# Altium schematic sheet Display.SchDoc: Display
size Tabloid; Author: Adam Turaj; SheetNumber: 6; SheetTotal: 6
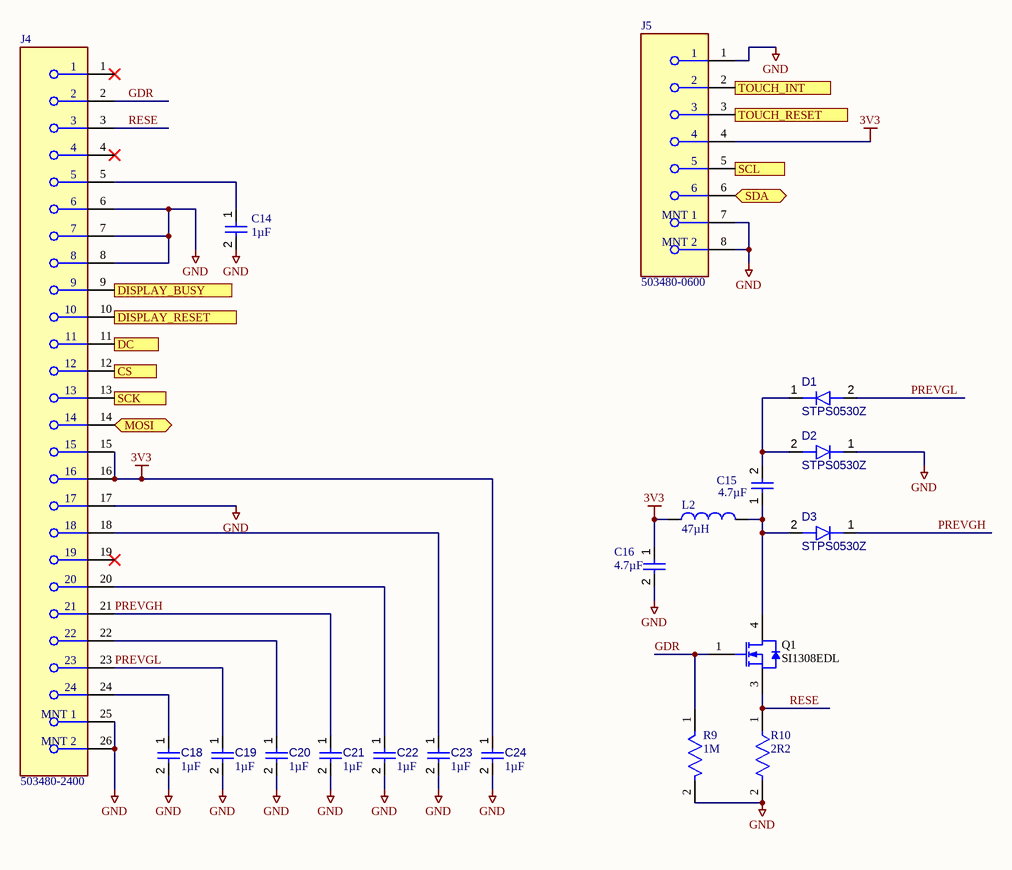
[diagram p0: Display.SchDoc]

## Parts
C14  1µF  [CAPC1608X90X40LL10T20]
C15  4.7µF  [CAPC0603(1608)100_L]
C16  4.7µF  [CAPC0603(1608)100_L]
C18  value 1µF  [CAPC0603(1608)100_L]  (hidden comment: Capacitor 1µF +/-0.1% 25V 0603)
C19  value 1µF  [CAPC0603(1608)100_L]  (hidden comment: Capacitor 1µF +/-0.1% 25V 0603)
C20  value 1µF  [CAPC0603(1608)100_L]  (hidden comment: Capacitor 1µF +/-0.1% 25V 0603)
C21  value 1µF  [CAPC0603(1608)100_L]  (hidden comment: Capacitor 1µF +/-0.1% 25V 0603)
C22  value 1µF  [CAPC0603(1608)100_L]  (hidden comment: Capacitor 1µF +/-0.1% 25V 0603)
C23  value 1µF  [CAPC0603(1608)100_L]  (hidden comment: Capacitor 1µF +/-0.1% 25V 0603)
C24  value 1µF  [CAPC0603(1608)100_L]  (hidden comment: Capacitor 1µF +/-0.1% 25V 0603)
D1  STPS0530Z  [MCC-SOD123_V]
D2  STPS0530Z  [MCC-SOD123_V]
D3  STPS0530Z  [MCC-SOD123_V]
J4  503480-2400  [FP-503480-2400-MFG]
J5  503480-0600  [MOLX-503480-0600]
L2  value 47µH  [FP-SDE0403AT-MFG]  (hidden comment: SDE0403AT-470K)
Q1  SI1308EDL  [FP-5549-IPC_A]
R9  1M  [FP-RC0603-0_55-IPC_C]
R10  2R2  [FP-RC0603-0_55-IPC_A]

## Ports
CS (in, see Root[4B]), DC (in, see Root[4B]), DISPLAY_BUSY (out, see Root[4B], MCU[5B]), DISPLAY_RESET (in, see Root[4B], MCU[5B]), MOSI (bidir, see Root[4B]), SCK (in, see Root[4B]), SCL (in, see Root[4B], Battery_Charger[2C], IMU[4B], MCU[5B]), SDA (bidir, see Root[4B], Battery_Charger[2C], IMU[4B], MCU[5B]), TOUCH_INT (out, see Root[4C], MCU[3C]), TOUCH_RESET (in, see Root[4B], MCU[3C])

## Nets
3V3: C16.1 C24.1 J4.15 J4.16 J5.4 L2.1
GND: C14.2 C16.2 C18.2 C19.2 C20.2 C21.2 C22.2 C23.2 C24.2 D2.1(K) J4.6 J4.7 J4.8 J4.17 J4.25(MNT_1) J4.26(MNT_2) J5.1 J5.7(MNT_1) J5.8(MNT_2) R9.2 R10.2
CS: J4.12 ; port CS
DC: J4.11 ; port DC
DISPLAY_BUSY: J4.9 ; port DISPLAY_BUSY
DISPLAY_RESET: J4.10 ; port DISPLAY_RESET
GDR: J4.2 Q1.1(G) R9.1
MOSI: J4.14 ; port MOSI
PREVGH: C21.1 D3.1(K) J4.21
PREVGL: C19.1 D1.2(A) J4.23
RESE: J4.3 Q1.3(S) R10.1
SCK: J4.13 ; port SCK
SCL: J5.5 ; port SCL
SDA: J5.6 ; port SDA
TOUCH_INT: J5.2 ; port TOUCH_INT
TOUCH_RESET: J5.3 ; port TOUCH_RESET
NetC14_1: C14.1 J4.5
NetC15_1: C15.1 D3.2(A) L2.2 Q1.4(D)
NetC15_2: C15.2 D1.1(K) D2.2(A)
NetC18_1: C18.1 J4.24
NetC20_1: C20.1 J4.22
NetC22_1: C22.1 J4.20
NetC23_1: C23.1 J4.18

Not connected (* = marked no-connect by the designer): J4 1* 4* 19*

## Notes on the sheet
- Title:
- Author:
- Size:
- Date:
- Git Hash:
- Tabloid
- Prj:
- Variant:
- Edited:
- File:

## Library data of the parts
C14 = CMP-001-00005-6: Chip Capacitor, 1 uF, +/- 10%, 25 V, 0603 (1608 Metric); Capacitor Type: Ceramic; Voltage Rating: 25V; Pins: 2; Value: 1µF; Mounting Technology: SM; RoHS Compliant: True; Max Operating Temperature: 125°C; Case/Package: 0603; Min Operating Temperature: -55°C; Tolerance: 10%
C15 = CMP-001-00076-4: Chip Capacitor, 4.7µF +/-20%, 25V, 0603, Thickness 1 mm; Tolerance: 10%; Mounting Technology: SMT; Case/Package: 0603; Pins: 2; Min Operating Temperature: -55°C; Max Operating Temperature: 85°C; Value: 4.7µF; Voltage Rating: 25V
C16 = CMP-001-00076-4: Chip Capacitor, 4.7µF +/-20%, 10V, 0603, Thickness 1 mm; Tolerance: 10%; Mounting Technology: SMT; Case/Package: 0603; Pins: 2; Min Operating Temperature: -55°C; Max Operating Temperature: 85°C; Value: 4.7µF; Voltage Rating: 10V
C18-C24 = CMP-001-00055-4: Chip Capacitor, 1µF +/-0.1%, 25V, 0603, Thickness 1 mm; Tolerance: 20%; Min Operating Temperature: -55°C; Max Operating Temperature: 85°C; Voltage Rating: 25V; Mounting Technology: SMT; Case/Package: 0603; Pins: 2
D1-D3 = CMP-004-00031-1: SCHOTTKY RECTIFIER Rectifier Diode, Schottky, 1 Phase, 1 Element, 0.5A, 30V V(RRM), Silicon; Forward Current: 500mA; Max Surge Current: 5.5A; Forward Voltage: 220mV; Min Operating Temperature: -40°C; Mounting Technology: Surface Mount; Pins: 2; Max Operating Temperature: 150°C
J4 = CMP-002-00076-1: Molex 503480-2400 FFC & FPC Connectors, 0.5mm, FPC Ra Smt Dual Cont 24 Circuit,; Voltage Rating: 50V; Gender: Female; Max Operating Temperature: 105°C; Min Operating Temperature: -40°C; Mounting Technology: Surface Mount; Pins: 24
J5 = CMP-002-00077-1: FFC and FPC Connectors; MOLEX; 503480-0600; Gold; Surface Mount; 500 mA; 6; Voltage Rating: 50V; Gender: Female; Max Operating Temperature: 105°C; Mounting Technology: Surface Mount; Min Operating Temperature: -40°C; Pins: 6
L2 = CMP-006-00026-2: Inductor Power Unshielded Wirewound 47uH 10% 1MHz Ferrite 0.5A 0.631Ohm DCR Automotive AEC-Q200; Max Current Rating: 500mA; Self Resonant Frequency: 16MHz; Case/Package: 1816; Tolerance: 10%; Min Operating Temperature: -55°C; Max Operating Temperature: 150°C
Q1 = CMP-013-00034-1: SI1308EDL-T1-GE3 N-channel Mosfet Transistor, 1.5 A, 30 V, 3-PIN SC-70; Case/Package: SOT-323; Mounting Technology: Surface Mount; Min Operating Temperature: -55°C; Pins: 3; Max Operating Temperature: 150°C
R9 = CMP-2000-06953-2: RES SMD 1M OHM 5% 1/10W 0603; Voltage Rating (DC): 50V; Power Rating: 100mW; Temperature Coefficient: 100ppm/°C; Resistance: 1MR; Features: Moisture Resistant; Package Quantity: 5000; Case Code (Imperial): 0603; Packaging: Tape and Reel; Resistor Type: Thick Film; Number of Pins: 2; Size Code: 0603; Resistance Tolerance: 5%; Max Operating Temperature: 155°C; Voltage Rating: 50V; Depth: 0.8mm; Termination: SMD/SMT; Width: 0.8mm; RoHS Compliant: Yes; Number of Terminations: 2; Height: 0.45mm; Lead Free: Lead Free; Case/Package: 0603; Military Standard: Not; Min Operating Temperature: -55°C; Case Code (Metric): 1608; Radiation Hardening: No; Series: RC; Length: 1.6mm; Tolerance: 5%; REACH SVHC: No SVHC; Contact Plating: Tin; Construction: Rectangular; Max Power Dissipation: 100mW
R10 = CMP-03412-037810-1: RES SMD 2.2 OHM 1% 1/10W 0603; Voltage Rating: 50V; Max Power Dissipation: 100mW; Resistance: 2.2R; Temperature Coefficient: 200ppm/°C; Lead Free: Lead Free; Series: RC; Resistor Type: Thick Film; Case Code (Imperial): 0603; Number of Pins: 2; Min Operating Temperature: -55°C; Packaging: Tape and Reel; Length: 0.063inch; Power Rating: 100mW; Features: Moisture Resistant; Resistance Tolerance: 1%; Termination: SMD/SMT; Width: 0.031inch; REACH SVHC: No SVHC; Case Code (Metric): 1608; Height: 0.022inch; Voltage Rating (DC): 50V; Size Code: 0603; Max Operating Temperature: 155°C; Case/Package: 0603; Number of Terminations: 2; Depth: 0.8mm; Tolerance: 1%; RoHS Compliant: Yes; Technology: THICK FILM; Package Quantity: 1